# Altium project Zulu_a7_no_pmod_SI.PrjPcb (part 1 of 3)
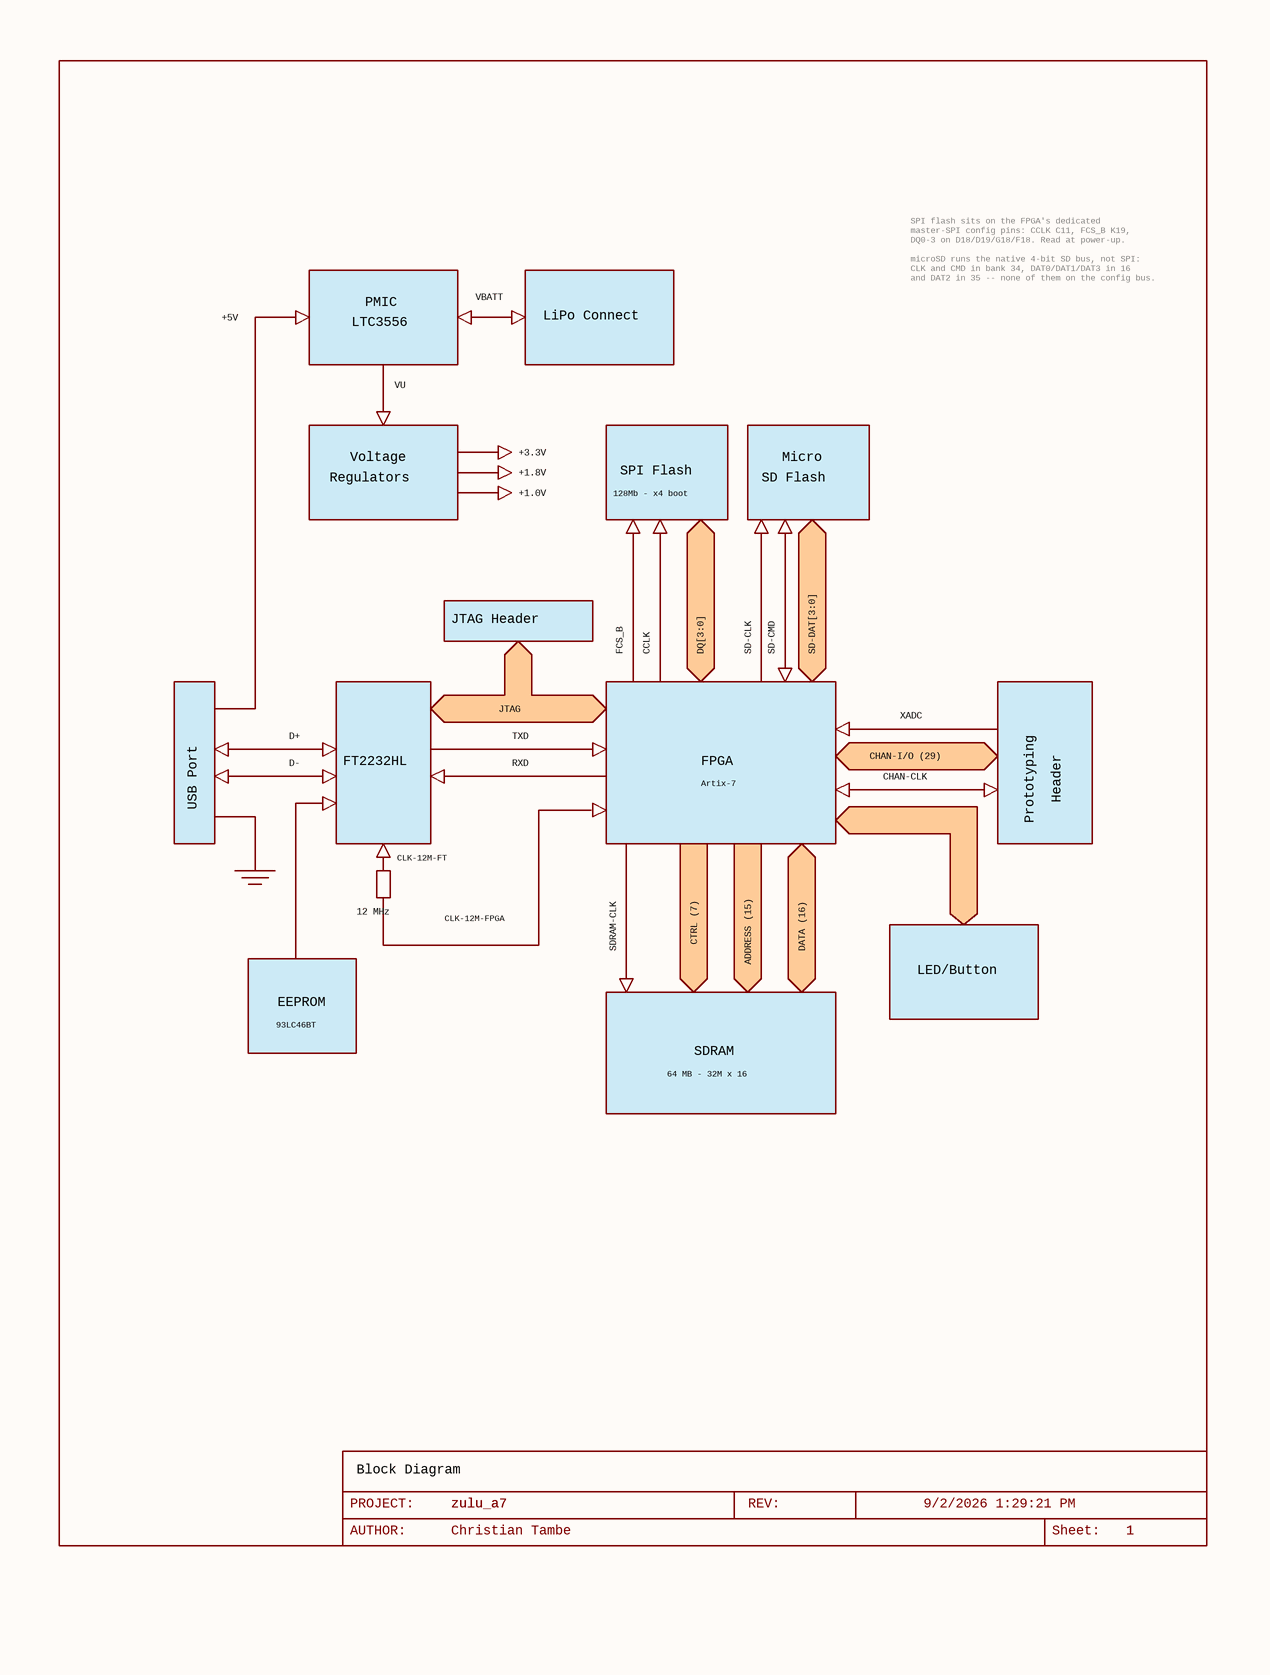
[diagram p0: zulu_a7_0.SchDoc]
7 sheets, 185 parts. Net scope: global (net labels, ports and power ports of the same name join across sheets).
Board file: Zulu_a7_no_pmod_SI.PcbDoc
Sheets:
  zulu_a7_0.SchDoc
  zulu_a7_1.SchDoc
  zulu_a7_2.SchDoc
  zulu_a7_3.SchDoc
  zulu_a7_4.SchDoc
  zulu_a7_5.SchDoc
  zulu_a7_6.SchDoc

## Sheet zulu_a7_0.SchDoc
size 236 x 313 mm; Author: Christian Tambe; VERSION#: 1.0; Origin: Eagle; OriginPath: C:\Users\tambe\Documents\Electronics\Zulu_A7\Zulu_Altrium\zulu_a7.sch; OriginSheet: 1; OriginDescription: Block Diagram

### Parts
FRAME1  LAST_DATE_TIME: 9/2/2026 1:29:21 PM  Sheet: Sheet:  SHEET: 1  REV: REV:  PROJECT: PROJECT:  DRAWING_NAME: zulu_a7  AUTHOR: Christian Tambe  (hidden comment: DOCFIELD)  (graphical)

### Notes on the sheet
- SPI flash sits on the FPGA's dedicated
  master-SPI config pins: CCLK C11, FCS_B K19,
  DQ0-3 on D18/D19/G18/F18. Read at power-up.
  microSD runs the native 4-bit SD bus, not SPI:
  CLK and CMD in bank 34, DAT0/DAT1/DAT3 in 16
  and DAT2 in 35 -- none of them on the config bus.
- +5V
- LTC3556
- PMIC
- VBATT
- LiPo Connect
- VU
- Regulators
- Voltage
- +3.3V
- +1.8V
- SPI Flash
- SD Flash
- Micro
- +1.0V
- 128Mb - x4 boot
- JTAG Header
- FCS_B
- CCLK
- DQ[3:0]
- SD-CLK
- SD-CMD
- SD-DAT[3:0]
- D+
- JTAG
- TXD
- XADC
- USB Port
- D-
- FT2232HL
- RXD
- FPGA
- Artix-7
- CHAN-I/O (29)
- CHAN-CLK
- Prototyping
- Header
- CLK-12M-FT
- 12 MHz
- CLK-12M-FPGA
- SDRAM-CLK
- CTRL (7)
- DATA (16)
- EEPROM
- ADDRESS (15)
- LED/Button
- 93LC46BT
- 64 MB - 32M x 16
- SDRAM
- (near FRAME1) Block Diagram
- (near FRAME1) AUTHOR:

### Library data of the parts
FRAME1 = DOCFIELD: DOCUMENT FIELD; GateName_1: G$1; SymbolName_1: DOCFIELD; LibraryName: ctambe; DeviceSetName: DOCFIELD

## Sheet zulu_a7_1.SchDoc
size 236 x 314 mm; Author: Christian Tambe; VERSION#: 1.0; Origin: Eagle; OriginPath: C:\Users\tambe\Documents\Electronics\Zulu_A7\Zulu_Altrium\zulu_a7.sch; OriginSheet: 2; OriginDescription: Power Supplies
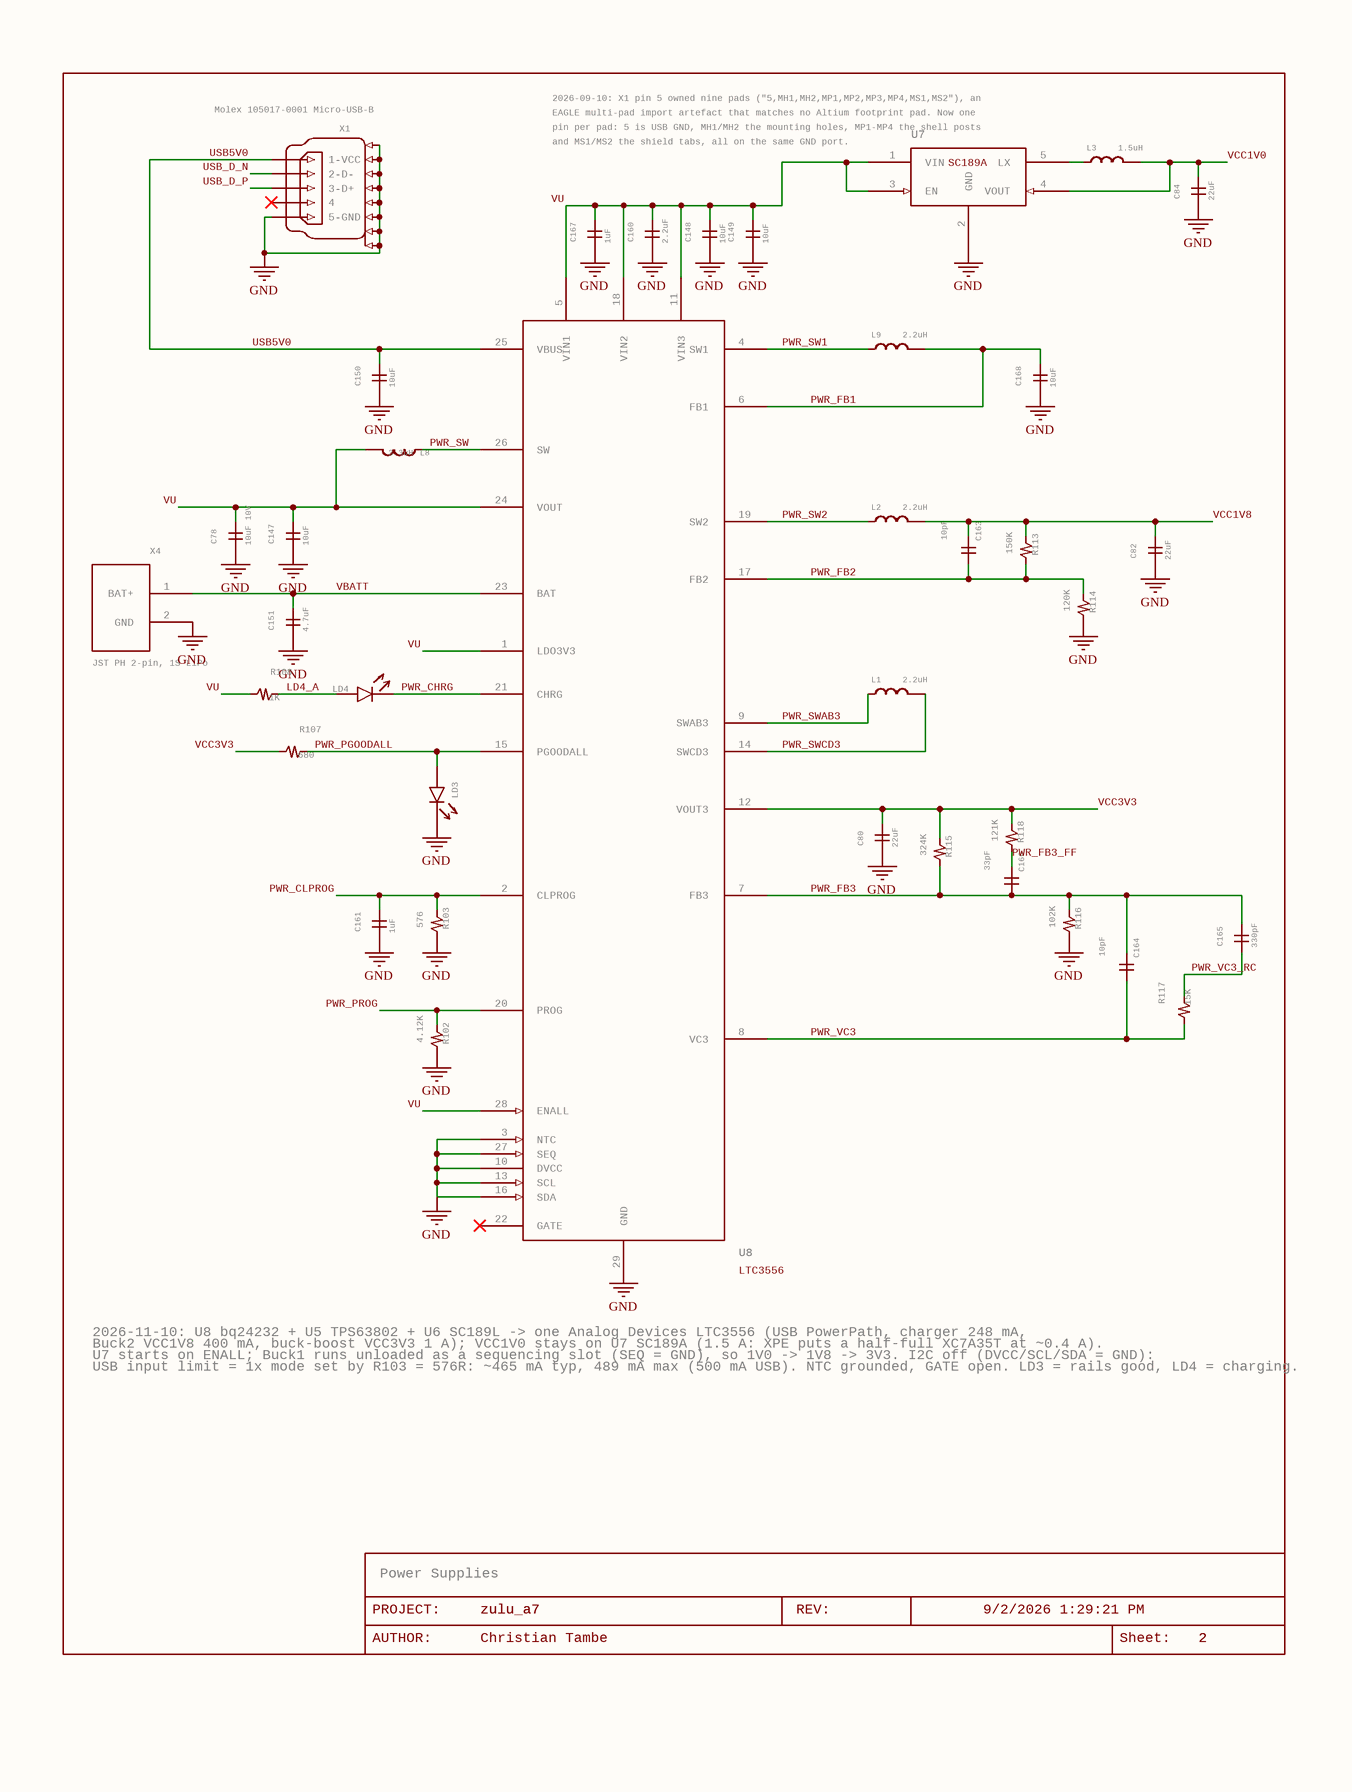
[diagram p1: zulu_a7_1.SchDoc]

### Parts
C78  10uF 10V  [C0805]
C80  22uF  [C0805]
C82  22uF  [C0603]
C84  22uF  [C0603]
C147  10uF  [C0603]
C148  10uF  [C0603]
C149  10uF  [C0805]
C150  10uF  [C0603]
C151  4.7uF  [C0603]
C160  2.2uF  [C0402]
C161  1uF  [C0402]
C163  10pF  [C0201]
C164  10pF  [C0201]
C165  330pF  [C0201]
C166  33pF  [C0201]
C167  1uF  [C0402]
C168  10uF  [C0603]
FRAME5  LAST_DATE_TIME: 9/2/2026 1:29:21 PM  Sheet: Sheet:  SHEET: 2  REV: REV:  PROJECT: PROJECT:  DRAWING_NAME: zulu_a7  AUTHOR: Christian Tambe  (hidden comment: DOCFIELD)  (graphical)
L1  2.2uH  [IND2520]
L2  2.2uH  [IND2520]
L3  1.5uH  [IND2520]
L8  3.3uH  [IND2520]
L9  2.2uH  [IND2520]
LD3  green  [LED0603]  (value not drawn)
LD4  green  [LED0603]  (value not drawn)
R102  4.12K  [R0402]
R103  576  [R0402]
R107  680  [R0402]
R108  1K  [R0402]
R113  150K  [R0201]
R114  120K  [R0201]
R115  324K  [R0201]
R116  102K  [R0201]
R117  15K  [R0201]
R118  121K  [R0201]
U7  PartName: SC189A  [SOT23-5]  (hidden comment: SC189ASKTRT)
U8  PartName: LTC3556  [QFN28-UFD-4X5]  (hidden comment: LTC3556EUFD#PBF)
X1  Molex 105017-0001 Micro-USB-B  [MOLEX-105017-0001]
X4  JST PH 2-pin, 1S LiPo  [JST-B2B-PH-SM4-TB]

### Nets
GND: C78.1 C80.1 C82.1 C84.1 C147.1 C148.1 C149.1 C150.1 C151.1 C160.1 C161.1 C167.1 C168.1 LD3.K R102.2 R103.2 R114.2 R116.2 U7.2(GND) U8.3(NTC) U8.10(DVCC) U8.13(SCL) U8.16(SDA) U8.27(SEQ) U8.29(GND) X1.5(5-GND) X1.MH1(GND) X1.MH2(GND) X1.MP1(GND) X1.MP2(GND) X1.MP3(GND) X1.MP4(GND) X1.MS1(GND) X1.MS2(GND) X4.2(GND)
VCC1V0: C84.2 L3.2 U7.4(VOUT)
VCC1V8: C82.2 C163.1 L2.2 R113.1
VCC3V3: C80.2 R107.1 R115.1 R118.1 U8.12(VOUT3)
LD4_A: LD4.A R108.2
PWR_CHRG: LD4.K U8.21(CHRG)
PWR_CLPROG: C161.2 R103.1 U8.2(CLPROG)
PWR_FB1: C168.2 L9.2 U8.6(FB1)
PWR_FB2: C163.2 R113.2 R114.1 U8.17(FB2)
PWR_FB3: C164.1 C165.2 C166.2 R115.2 R116.1 U8.7(FB3)
PWR_FB3_FF: C166.1 R118.2
PWR_PGOODALL: LD3.A R107.2 U8.15(PGOODALL)
PWR_PROG: R102.1 U8.20(PROG)
PWR_SW: L8.1 U8.26(SW)
PWR_SW1: L9.1 U8.4(SW1)
PWR_SW2: L2.1 U8.19(SW2)
PWR_SWAB3: L1.1 U8.9(SWAB3)
PWR_SWCD3: L1.2 U8.14(SWCD3)
PWR_VC3: C164.2 R117.1 U8.8(VC3)
PWR_VC3_RC: C165.1 R117.2
USB5V0: C150.2 U8.25(VBUS) X1.1(1-VCC)
USB_D_N: X1.2(2-D-)
USB_D_P: X1.3(3-D+)
VBATT: C151.2 U8.23(BAT) X4.1(BAT+)
VU: C78.2 C147.2 C148.2 C149.2 C160.2 C167.2 L8.2 R108.1 U7.1(VIN) U7.3(EN) U8.1(LDO3V3) U8.5(VIN1) U8.11(VIN3) U8.18(VIN2) U8.24(VOUT) U8.28(ENALL)
NetL3_1: L3.1 U7.5(LX)

Not connected (* = marked no-connect by the designer): U8 22(GATE)*; X1 4*

### Notes on the sheet
- 2026-09-10: X1 pin 5 owned nine pads ("5,MH1,MH2,MP1,MP2,MP3,MP4,MS1,MS2"), an
- (near U7) EAGLE multi-pad import artefact that matches no Altium footprint pad. Now one
- (near U7) pin per pad: 5 is USB GND, MH1/MH2 the mounting holes, MP1-MP4 the shell posts
- and MS1/MS2 the shield tabs, all on the same GND port.
- 2026-11-10: U8 bq24232 + U5 TPS63802 + U6 SC189L -> one Analog Devices LTC3556 (USB PowerPath, charger 248 mA,
- Buck2 VCC1V8 400 mA, buck-boost VCC3V3 1 A); VCC1V0 stays on U7 SC189A (1.5 A: XPE puts a half-full XC7A35T at ~0.4 A).
- U7 starts on ENALL; Buck1 runs unloaded as a sequencing slot (SEQ = GND), so 1V0 -> 1V8 -> 3V3. I2C off (DVCC/SCL/SDA = GND):
- USB input limit = 1x mode set by R103 = 576R: ~465 mA typ, 489 mA max (500 mA USB). NTC grounded, GATE open. LD3 = rails good, LD4 = charging.
- (near FRAME5) Power Supplies
- (near FRAME5) AUTHOR:

### Library data of the parts
C78 = C-GENERICC0603: CAPACITOR, generic non-polarized, horizontal pins; GateName_1: G$1; SymbolName_1: C-GENERIC-H; MANF: Samsung; MANF#: CL21A106KPFNNNG; SPEC: X5R 10V +-10% 0805 10uF -- VU bulk; DeviceName: C0805; LibraryName: rcl; DeviceSetName: C-GENERIC
C80 = C-GENERICC0603: CAPACITOR, generic non-polarized, horizontal pins; GateName_1: G$1; SymbolName_1: C-GENERIC-H; MANF: Murata; MANF#: GRM21BR61A226ME44L; SPEC: X5R 10V +-20% 0805 22uF -- buck-boost (VCC3V3) output capacitor, the 22 uF the Type III values assume; DeviceName: C0805; LibraryName: rcl; DeviceSetName: C-GENERIC
C82 = C-GENERICC0603: CAPACITOR, generic non-polarized, horizontal pins; GateName_1: G$1; SymbolName_1: C-GENERIC-H; MANF: Samsung; MANF#: CL10A226MP8NUNE; SPEC: X5R 10V +-20% 0603 22uF -- Buck2 (VCC1V8) output capacitor; DeviceName: C0603; LibraryName: rcl; DeviceSetName: C-GENERIC
C84 = C-GENERICC0603: CAPACITOR, generic non-polarized, horizontal pins; GateName_1: G$1; SymbolName_1: C-GENERIC-H; MANF: Samsung; MANF#: CL10A226MP8NUNE; SPEC: X5R 10V +-20% 0603 22uF -- U7 SC189A (VCC1V0) output capacitor; DeviceName: C0603; LibraryName: rcl; DeviceSetName: C-GENERIC
C147 = C-GENERICC0603: CAPACITOR, generic non-polarized, horizontal pins; GateName_1: G$1; SymbolName_1: C-GENERIC-H; MANF: Murata; MANF#: GRM188R61A106KE69D; SPEC: X5R 10V +-10% 0603 10uF -- LTC3556 VOUT (PowerPath output, pin 24) bypass; DeviceName: C0603; LibraryName: rcl; DeviceSetName: C-GENERIC
C148 = C-GENERICC0603: CAPACITOR, generic non-polarized, horizontal pins; GateName_1: G$1; SymbolName_1: C-GENERIC-H; MANF: Murata; MANF#: GRM188R61A106KE69D; SPEC: X5R 10V +-10% 0603 10uF -- LTC3556 VIN3 (buck-boost input, pin 11) bypass; DeviceName: C0603; LibraryName: rcl; DeviceSetName: C-GENERIC
C149 = C-GENERICC0805: CAPACITOR, generic non-polarized, horizontal pins; GateName_1: G$1; SymbolName_1: C-GENERIC-H; MANF: Samsung; MANF#: CL21A106KPFNNNG; SPEC: X5R 10V +-10% 0805 10uF -- U7 SC189A VIN bypass (>= 4.7 uF effective); DeviceName: C0805; LibraryName: rcl; DeviceSetName: C-GENERIC
C150 = C-GENERICC0603: CAPACITOR, generic non-polarized, horizontal pins; GateName_1: G$1; SymbolName_1: C-GENERIC-H; MANF: Murata; MANF#: GRM188R61C106MA73D; SPEC: X5R 16V +-20% 0603 10uF -- LTC3556 VBUS bypass (pin 25); DeviceName: C0603; LibraryName: rcl; DeviceSetName: C-GENERIC
C151 = C-GENERICC0603: CAPACITOR, generic non-polarized, horizontal pins; GateName_1: G$1; SymbolName_1: C-GENERIC-H; MANF: Murata; MANF#: GRM188R61C475KE11D; SPEC: X5R 16V +-10% 0603 4.7uF -- LTC3556 BAT bypass (pin 23), 1-22 uF ceramic; DeviceName: C0603; LibraryName: rcl; DeviceSetName: C-GENERIC
C160 = C-GENERICC0603: CAPACITOR, generic non-polarized, horizontal pins; GateName_1: G$1; SymbolName_1: C-GENERIC-H; MANF: Murata; MANF#: GRM155R61A225KE95D; SPEC: X5R 10V +-10% 0402 2.2uF -- LTC3556 VIN2 (Buck2 input, pin 18) bypass; DeviceName: C0402; LibraryName: rcl; DeviceSetName: C-GENERIC
C161 = C-GENERICC0603: CAPACITOR, generic non-polarized, horizontal pins; GateName_1: G$1; SymbolName_1: C-GENERIC-H; MANF: Murata; MANF#: GRM155R61A105KE15D; SPEC: X5R 10V +-10% 0402 1uF -- LTC3556 CLPROG averaging capacitor (>= 0.47 uF); DeviceName: C0402; LibraryName: rcl; DeviceSetName: C-GENERIC
C163 = C-GENERICC0603: CAPACITOR, generic non-polarized, horizontal pins; GateName_1: G$1; SymbolName_1: C-GENERIC-H; MANF: Murata; MANF#: GRM0335C1H100JA01D; SPEC: C0G 50V +-5% 0201 10pF -- Buck2 feed-forward across R113; DeviceName: C0201; LibraryName: rcl; DeviceSetName: C-GENERIC
C164 = C-GENERICC0603: CAPACITOR, generic non-polarized, horizontal pins; GateName_1: G$1; SymbolName_1: C-GENERIC-H; MANF: Murata; MANF#: GRM0335C1H100JA01D; SPEC: C0G 50V +-5% 0201 10pF -- Type III C1 (FB3 to VC3); DeviceName: C0201; LibraryName: rcl; DeviceSetName: C-GENERIC
C165 = C-GENERICC0603: CAPACITOR, generic non-polarized, horizontal pins; GateName_1: G$1; SymbolName_1: C-GENERIC-H; MANF: Murata; MANF#: GRM0335C1H331JA01D; SPEC: C0G 50V +-5% 0201 330pF -- Type III C2; DeviceName: C0201; LibraryName: rcl; DeviceSetName: C-GENERIC
C166 = C-GENERICC0603: CAPACITOR, generic non-polarized, horizontal pins; GateName_1: G$1; SymbolName_1: C-GENERIC-H; MANF: Murata; MANF#: GRM0335C1H330JA01D; SPEC: C0G 50V +-5% 0201 33pF -- Type III C3; DeviceName: C0201; LibraryName: rcl; DeviceSetName: C-GENERIC
C167 = C-GENERICC0603: CAPACITOR, generic non-polarized, horizontal pins; GateName_1: G$1; SymbolName_1: C-GENERIC-H; MANF: Murata; MANF#: GRM155R61A105KE15D; SPEC: X5R 10V +-10% 0402 1uF -- LTC3556 VIN1 (Buck1 input, pin 5) bypass, the 1 uF the datasheet asks for; DeviceName: C0402; LibraryName: rcl; DeviceSetName: C-GENERIC
C168 = C-GENERICC0603: CAPACITOR, generic non-polarized, horizontal pins; GateName_1: G$1; SymbolName_1: C-GENERIC-H; MANF: Murata; MANF#: GRM188R61A106KE69D; SPEC: X5R 10V +-10% 0603 10uF -- LTC3556 Buck1 output (sequencing slot, FB1 tied to it: 0.8 V, no load); DeviceName: C0603; LibraryName: rcl; DeviceSetName: C-GENERIC
FRAME5 = DOCFIELD: DOCUMENT FIELD; GateName_1: G$1; SymbolName_1: DOCFIELD; LibraryName: ctambe; DeviceSetName: DOCFIELD
L1 = INDUCTOR-2520: INDUCTOR, generic power inductor; GateName_1: G$1; MANF: Murata; MANF#: DFE252012F-2R2M=P2; SPEC: 2.2uH +-20%, Isat 3.3 A, Itemp 2.3 A, DCR 82 mOhm max, 2520 1.2 mm -- LTC3556 buck-boost (VCC3V3) inductor, SWAB3 to SWCD3; SymbolName_1: INDUCTOR; DeviceName: IND2520; LibraryName: ctambe; DeviceSetName: INDUCTOR
L2 = INDUCTOR-2520: INDUCTOR, generic power inductor; GateName_1: G$1; MANF: Murata; MANF#: DFE252012F-2R2M=P2; SPEC: 2.2uH +-20%, Isat 3.3 A, Itemp 2.3 A, DCR 82 mOhm max, 2520 1.2 mm -- LTC3556 Buck2 (VCC1V8) inductor (2520 like L1/L3: no verified Murata land pattern for the 2016 part); SymbolName_1: INDUCTOR; DeviceName: IND2520; LibraryName: ctambe; DeviceSetName: INDUCTOR
L3 = INDUCTOR-2520: INDUCTOR, generic power inductor; GateName_1: G$1; DeviceName: -2520; MANF: Murata; MANF#: DFE252010P-1R5M=P2; SPEC: 1.5uH +-20%, Isat >=1.8A, 1.00 mm max -- U7 SC189A LX inductor (VCC1V0), 2.5 MHz, <=0.31 A p-p ripple; SymbolName_1: INDUCTOR; LibraryName: ctambe; DeviceSetName: INDUCTOR
L8 = INDUCTOR-2520: INDUCTOR, generic power inductor; GateName_1: G$1; MANF: Murata; MANF#: DFE252012F-3R3M=P2; SPEC: 3.3uH +-20%, Isat 2.5 A, Itemp 1.8 A, DCR 135 mOhm max, 2520 1.2 mm -- LTC3556 PowerPath inductor (SW to VOUT); SymbolName_1: INDUCTOR; DeviceName: IND2520; LibraryName: ctambe; DeviceSetName: INDUCTOR
L9 = INDUCTOR-2520: INDUCTOR, generic power inductor; GateName_1: G$1; MANF: Murata; MANF#: DFE252012F-2R2M=P2; SPEC: 2.2uH +-20%, 2520 -- LTC3556 Buck1 kept running unloaded as the sequencing slot (SEQ = GND: Buck1 -> Buck2 -> buck-boost), so 1.8 V starts after U7 has brought up 1.0 V; SymbolName_1: INDUCTOR; DeviceName: IND2520; LibraryName: ctambe; DeviceSetName: INDUCTOR
LD3 = LED: GateName_1: G$1; MANF: Lite-On; MANF#: LTST-C191KGKT; NOTE: Power good: R107 680R from VCC3V3 lights LD3 once LTC3556 PGOODALL (pin 15, open drain) releases; PGOODALL holds it off until all three bucks are in regulation; SPEC: green -- LTC3556 PGOODALL: all three rails good (lights 230 ms after VCC3V3 is up); SymbolName_1: LED; LibraryName: ctambe; DeviceSetName: LED
LD4 = LED: GateName_1: G$1; MANF: Lite-On; MANF#: LTST-C191KGKT; NOTE: Charge status: LTC3556 CHRG (pin 21, open drain) sinks LD4 through R108 1.0k from VU while the battery charges; SPEC: green -- LTC3556 CHRG: on = charging, off = done / no USB, fast blink = bad battery; SymbolName_1: LED; LibraryName: ctambe; DeviceSetName: LED
R102 = R-US_SMALLR0402: RESISTOR, American symbol, small 2-zigzag variant (sheet 2 only); GateName_1: G$1; MANF: Yageo; MANF#: RC0402FR-074K12L; SPEC: thick film +-1% 0402 -- LTC3556 PROG: 1022 V / 4.12k = 248 mA charge current; SymbolName_1: R-US_SMALL; DeviceName: R0402; LibraryName: rcl; DeviceSetName: R-US_SMALL
R103 = R-US_SMALLR0402: RESISTOR, American symbol, small 2-zigzag variant (sheet 2 only); GateName_1: G$1; MANF: Yageo; MANF#: RC0402FR-07576RL; SPEC: thick film +-1% 0402 -- LTC3556 CLPROG, 500 mA USB limit with I2C off (1x mode, hCLPROG 224): 1.188 V x 225 / 576 = 464 mA + 0.4 mA typ, ~425-489 mA over the datasheet spread; CLPROG pin 2.1 mA < 3 mA abs max; SymbolName_1: R-US_SMALL; DeviceName: R0402; LibraryName: rcl; DeviceSetName: R-US_SMALL
R107 = R-US_SMALLR0402: RESISTOR, American symbol, small 2-zigzag variant (sheet 2 only); GateName_1: G$1; MANF: Yageo; MANF#: RC0402FR-07680RL; SPEC: thick film +-1% 0402 -- PGOODALL pull-up and LD3 current: (3.3 - 2.0) / 680 = 1.9 mA; SymbolName_1: R-US_SMALL; DeviceName: R0402; LibraryName: rcl; DeviceSetName: R-US_SMALL
R108 = R-US_SMALLR0402: RESISTOR, American symbol, small 2-zigzag variant (sheet 2 only); GateName_1: G$1; MANF: Yageo; MANF#: RC0402FR-071KL; SPEC: thick film +-1% 0402 -- LD4 (CHRG) current: (3.7 - 2.0) / 1.0k = 1.7 mA; SymbolName_1: R-US_SMALL; DeviceName: R0402; LibraryName: rcl; DeviceSetName: R-US_SMALL
R113 = R-US_SMALLR0402: RESISTOR, American symbol, small 2-zigzag variant (sheet 2 only); GateName_1: G$1; MANF: Yageo; MANF#: RC0201FR-07150KL; SPEC: thick film +-1% 0201 -- Buck2 divider top: 0.8 V x (1 + 150k/120k) = 1.800 V; SymbolName_1: R-US_SMALL; DeviceName: R0201; LibraryName: rcl; DeviceSetName: R-US_SMALL
R114 = R-US_SMALLR0402: RESISTOR, American symbol, small 2-zigzag variant (sheet 2 only); GateName_1: G$1; MANF: Yageo; MANF#: RC0201FR-07120KL; SPEC: thick film +-1% 0201 -- Buck2 divider bottom; SymbolName_1: R-US_SMALL; DeviceName: R0201; LibraryName: rcl; DeviceSetName: R-US_SMALL
R115 = R-US_SMALLR0402: RESISTOR, American symbol, small 2-zigzag variant (sheet 2 only); GateName_1: G$1; MANF: Yageo; MANF#: RC0201FR-07324KL; SPEC: thick film +-1% 0201 -- buck-boost divider top / Type III R1 (sets the compensation; keep): 0.8 V x (1 + 324k/104k) = 3.29 V; SymbolName_1: R-US_SMALL; DeviceName: R0201; LibraryName: rcl; DeviceSetName: R-US_SMALL
R116 = R-US_SMALLR0402: RESISTOR, American symbol, small 2-zigzag variant (sheet 2 only); GateName_1: G$1; MANF: Yageo; MANF#: RC0201FR-07102KL; SPEC: thick film +-1% 0201 -- buck-boost divider bottom (RFB, DC only): VCC3V3 = 0.8 V x (1 + 324k/102k) = 3.34 V (2026-11-11: 104k 0.1% ERA-1AEB1043C does not exist; ERA-1AEB 0201 stops at 10k); SymbolName_1: R-US_SMALL; DeviceName: R0201; LibraryName: rcl; DeviceSetName: R-US_SMALL
R117 = R-US_SMALLR0402: RESISTOR, American symbol, small 2-zigzag variant (sheet 2 only); GateName_1: G$1; MANF: Yageo; MANF#: RC0201FR-0715KL; SPEC: thick film +-1% 0201 -- Type III R2 (with C165, VC3 to FB3); SymbolName_1: R-US_SMALL; DeviceName: R0201; LibraryName: rcl; DeviceSetName: R-US_SMALL
R118 = R-US_SMALLR0402: RESISTOR, American symbol, small 2-zigzag variant (sheet 2 only); GateName_1: G$1; MANF: Yageo; MANF#: RC0201FR-07121KL; SPEC: thick film +-1% 0201 -- Type III R3 (with C166 across R115); SymbolName_1: R-US_SMALL; DeviceName: R0201; LibraryName: rcl; DeviceSetName: R-US_SMALL
U7 = SC189-SOT23-5: 1.5A 2.5MHz synchronous buck, fixed output (Semtech SC189); MANF: Semtech; MANF#: SC189ASKTRT
U8 = LTC3556-UFD28: USB power manager: PowerPath + Li-ion charger + dual 400 mA buck + 1 A buck-boost (Analog Devices LTC3556, UFD QFN-28 4 x 5 mm); MANF: Analog Devices; MANF#: LTC3556EUFD#PBF
X1 = MINI-USB-105017-0001: MINI USB Connector   Source: http://www.hirose.co.jp/cataloge_hp/e24000019.pdf; GateName_1: G$1; SymbolName_1: MINI-USB; DeviceName: 105017-0001; LibraryName: ctambe; DeviceSetName: MINI-USB-; MANF: Molex; MANF#: 105017-0001
X4 = JST-B2B-PH-SM4-TB: JST PH 2.0 mm 2-pin top-entry SMT header, LiPo battery input; GateName_1: G$1; SymbolName_1: CONN-2; DeviceName: SM4-TB; DeviceSetName: JST-PH-2; MANF#: B2B-PH-SM4-TB(LF)(SN); SPEC: JST PH 2.0 mm, 2 circuits, top-entry SMT header with fixing tabs, 2 A, 100 V, -25..85 C, mates with PHR-2 housing; pin 1 = battery +, pin 2 = GND; NOTE: B2B-PH-SM4-TB(LF)(SN): 8 mm tall, wire leaves upward; the side-entry twin is S2B-PH-SM4-TB(LF)(SN) (5.5 mm). There is no polarity standard for JST-PH LiPo packs: check pin 1 = + against the pack before plugging in. Footprint JST-B2B-PH-SM4-TB to draw from the catalog page (two contact pads on 2.0 mm plus two 1.6 x 3.0 mm fixing pads). Digi-Key 57,541 in stock at $0.47 on 2026-09-09.; LibraryName: ctambe; MANF: JST

## Sheet zulu_a7_2.SchDoc
size 270 x 341 mm; Author: Christian Tambe; VERSION#: 1.0; Origin: Eagle; OriginPath: C:\Users\tambe\Documents\Electronics\Zulu_A7\Zulu_Altrium\zulu_a7.sch; OriginSheet: 3; OriginDescription: General IO
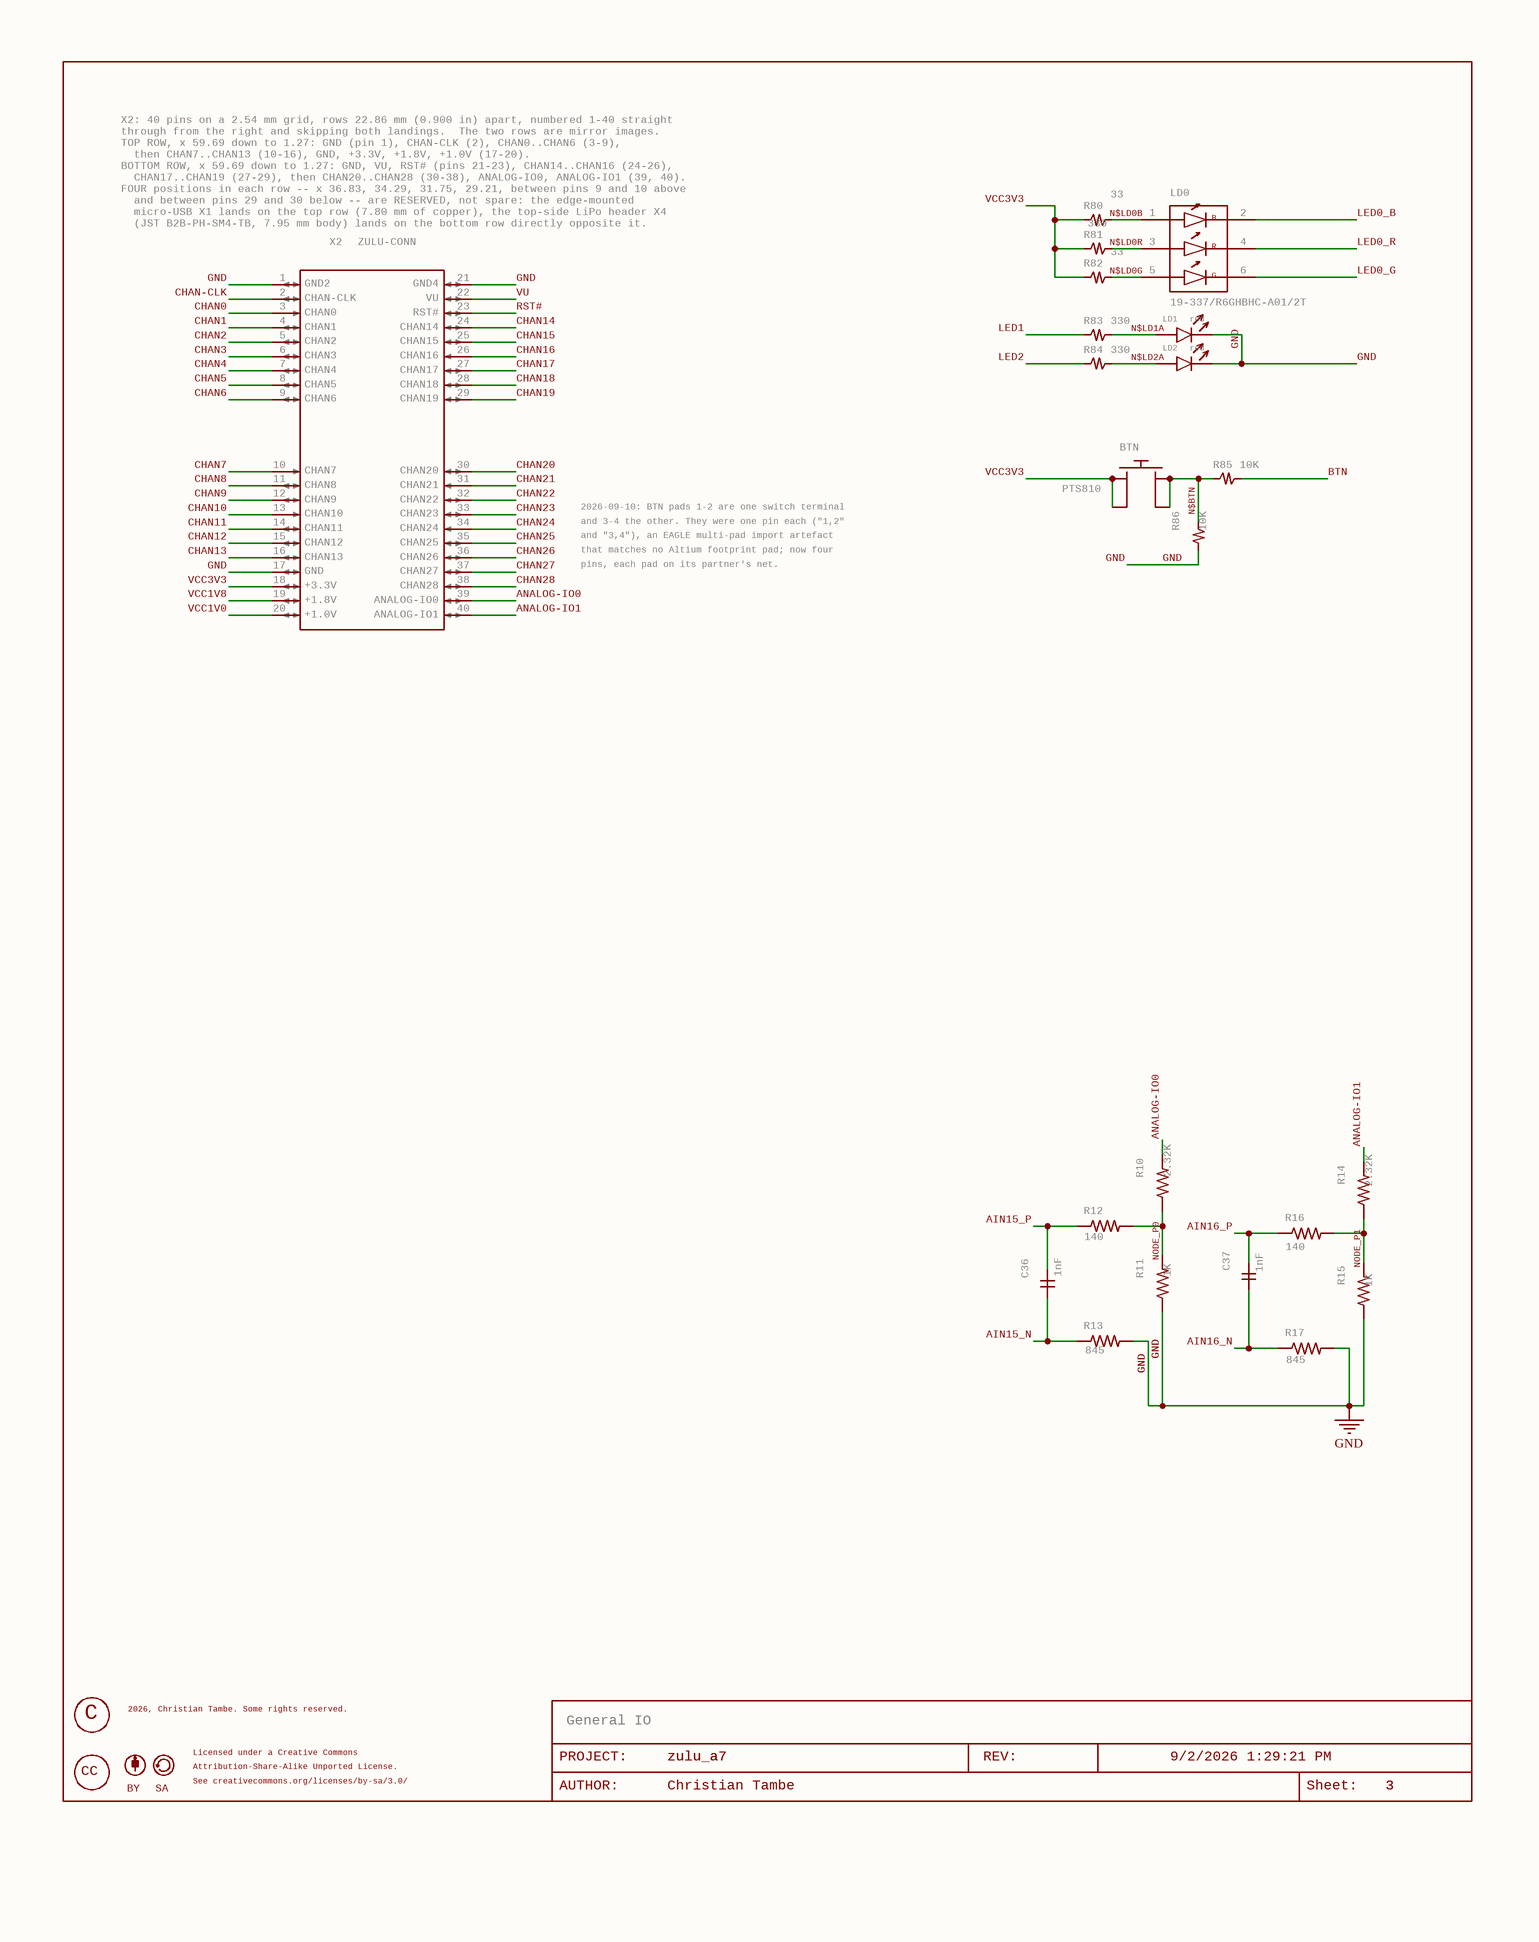
[diagram p2: zulu_a7_2.SchDoc]

### Parts
BTN  PTS810  [PTS810]
C36  1nF  [C0402]
C37  1nF  [C0402]
FRAME3  LAST_DATE_TIME: 9/2/2026 1:29:21 PM  Sheet: Sheet:  SHEET: 3  REV: REV:  PROJECT: PROJECT:  DRAWING_NAME: zulu_a7  AUTHOR: Christian Tambe  (hidden comment: DOCFIELD)  (graphical)
LD0  19-337/R6GHBHC-A01/2T  [EVERLIGHT-19-337]
LD1  red  [LED0603]
LD2  red  [LED0603]
R10  2.32K  [R0201]
R11  1K  [R0201]
R12  140  [R0201]
R13  845  [R0201]
R14  2.32K  [R0201]
R15  1K  [R0201]
R16  140  [R0201]
R17  845  [R0201]
R80  33  [R0402]
R81  330  [R0402]
R82  33  [R0402]
R83  330  [R0402]
R84  330  [R0402]
R85  10K  [R0402]
R86  10K  [R0402]
U$2  CC_CC  [CC_CC]  (value not drawn)
U$3  CC_BY  [CC_BY]  (value not drawn)
U$4  CC_SA  [CC_SA]  (value not drawn)
U$5  CC_COPYRIGHT  [CC_COPYRIGHT]  (value not drawn)
X2  GATE: CHAN-CLK  [ZULU-DIP37]  (hidden comment: ZULU-CONN)  (parts A,B,C,D,E,F,G,H,I,J,K,L,M,N,O,P,Q,R,S,T,U,V,W,X,Y,Z,27,28,29,30,31,32,33,34,35,36,37,38,39,40,41 of 41)

### Nets
GND: LD1.K LD2.K R11.1 R13.2 R15.1 R17.2 R86.1 X2.1 X2.17 X2.21
VCC1V0: X2.20
VCC1V8: X2.19
VCC3V3: BTN.1 BTN.2 R80.1 R81.1 R82.1 X2.18
AIN15_N: C36.1 R13.1
AIN15_P: C36.2 R12.1
AIN16_N: C37.1 R17.1
AIN16_P: C37.2 R16.1
ANALOG-IO0: R10.2 X2.39
ANALOG-IO1: R14.2 X2.40
BTN: R85.2
CHAN0: X2.3
CHAN1: X2.4
CHAN2: X2.5
CHAN3: X2.6
CHAN4: X2.7
CHAN5: X2.8
CHAN6: X2.9
CHAN7: X2.10
CHAN8: X2.11
CHAN9: X2.12
CHAN10: X2.13
CHAN11: X2.14
CHAN12: X2.15
CHAN13: X2.16
CHAN14: X2.24
CHAN15: X2.25
CHAN16: X2.26
CHAN17: X2.27
CHAN18: X2.28
CHAN19: X2.29
CHAN20: X2.30
CHAN21: X2.31
CHAN22: X2.32
CHAN23: X2.33
CHAN24: X2.34
CHAN25: X2.35
CHAN26: X2.36
CHAN27: X2.37
CHAN28: X2.38
CHAN-CLK: X2.2
LED0_B: LD0.2
LED0_G: LD0.6
LED0_R: LD0.4
LED1: R83.1
LED2: R84.1
N$BTN: BTN.3 BTN.4 R85.1 R86.2
N$LD0B: LD0.1 R80.2
N$LD0G: LD0.5 R82.2
N$LD0R: LD0.3 R81.2
N$LD1A: LD1.A R83.2
N$LD2A: LD2.A R84.2
NODE_P0: R10.1 R11.2 R12.2
NODE_P1: R14.1 R15.2 R16.2
RST#: X2.23
VU: X2.22

### Notes on the sheet
- (near X2) X2: 40 pins on a 2.54 mm grid, rows 22.86 mm (0.900 in) apart, numbered 1-40 straight
  through from the right and skipping both landings.  The two rows are mirror images.
  TOP ROW, x 59.69 down to 1.27: GND (pin 1), CHAN-CLK (2), CHAN0..CHAN6 (3-9),
  then CHAN7..CHAN13 (10-16), GND, +3.3V, +1.8V, +1.0V (17-20).
  BOTTOM ROW, x 59.69 down to 1.27: GND, VU, RST# (pins 21-23), CHAN14..CHAN16 (24-26),
  CHAN17..CHAN19 (27-29), then CHAN20..CHAN28 (30-38), ANALOG-IO0, ANALOG-IO1 (39, 40).
  FOUR positions in each row -- x 36.83, 34.29, 31.75, 29.21, between pins 9 and 10 above
  and between pins 29 and 30 below -- are RESERVED, not spare: the edge-mounted
  micro-USB X1 lands on the top row (7.80 mm of copper), the top-side LiPo header X4
  (JST B2B-PH-SM4-TB, 7.95 mm body) lands on the bottom row directly opposite it.
  Each landing is 12.70 mm between the neighbouring pin centres, 11.176 mm clear.
  THREE grounds: pins 1, 17, 21.  Pin 18 is the only +3.3V pin.  Pin 22 VU SOURCES the
  4.4 V rail (bq24232 OUT) -- the +5V-INPUT pin and its D2/D3 went on 2026-09-09,
  so external power is the LiPo on X4.  THE PCB FOOTPRINT MUST BE REDRAWN: 40 pads named 1-40.
- 2026-09-10: BTN pads 1-2 are one switch terminal
- and 3-4 the other. They were one pin each ("1,2"
- and "3,4"), an EAGLE multi-pad import artefact
- that matches no Altium footprint pad; now four
- pins, each pad on its partner's net.
- 2026, Christian Tambe. Some rights reserved.
- (near FRAME3) General IO
- (near U$4) Licensed under a Creative Commons
- (near U$4) Attribution-Share-Alike Unported License.
- (near U$4) See creativecommons.org/licenses/by-sa/3.0/
- (near FRAME3) AUTHOR:

### Library data of the parts
BTN = SWITCH_TACT: Tactile switch, momentary, normally open. Package PTA-142 is assigned and drawn from the datasheet land; the note that said otherwise was left behind when it was.; GateName_1: G$1; MANF#: PTS810SJM250SMTR LFS; MANF: Littelfuse (C&K); NOTE: PTS810SJM250SMTR LFS, Littelfuse (C&K) PTS810 series, Datasheet/Littelfuse-CK-Tactile-PTS810-Series-Datasheet.pdf rev 02/02/26. Recommended PCB layout (p1): four pads (5.2 - 3.1)/2 = 1.05 mm wide by (2.8 - 1.5)/2 = 0.65 mm high, centred at +-2.075 mm and +-1.075 mm; body 4.2 x 3.2 mm, J-leads to 4.6 mm, height 2.5 mm. The datasheet schematic joins 1 with 2 and 3 with 4, so pins 1,2 (VCC3V3) and 3,4 (BTN) are unchanged. Footprint PTS810 to be drawn at the PCB stage; the PTA-142 pattern (1.6 mm pads at +-3.75 / +-1.4 mm) does not fit. Other force grades on the same pads: K 2.6 N, G 4.0 N, S 6.0 N. Digi-Key 106,352 in stock at $0.58, 16-week lead (2026-09-08); LCSC C116501 dry, the K grade C221896 stocked.; SPEC: tactile switch SPST-NO momentary, SMT J-lead, 4.2 x 3.2 x 2.5 mm, 1.6 N (160 gf), 0.15 mm travel, 150000 cycles, 16 VDC 50 mA, -40..85 C; terminals 1-2 and 3-4 internally common (PTS810 sheet p1); replaced the unsourceable PTA-142 on 2026-09-08; SymbolName_1: SWITCH_TACT; LibraryName: ctambe; DeviceSetName: SWITCH_TACT
C36 C37 = C-GENERICC0402: CAPACITOR, generic non-polarized, horizontal pins; GateName_1: G$1; SymbolName_1: C-GENERIC-H; MANF: Murata; MANF#: GRM155R71H102KA01D; SPEC: X7R 50V +-10%, 0.50 mm max; DeviceName: C0402; LibraryName: rcl; DeviceSetName: C-GENERIC
FRAME3 = DOCFIELD: DOCUMENT FIELD; GateName_1: G$1; SymbolName_1: DOCFIELD; LibraryName: ctambe; DeviceSetName: DOCFIELD
LD0 = LED_RGB: RGB LED, three independent diodes, 6 pads: anodes 1/3/5 (B/R/G), cathodes 2/4/6 (B/R/G). Everlight 19-337 package.; GateName_1: G$1; NOTE: Everlight EAST1616RGBA8 = 19-337/R6GHBHW-A01/2T (DSE-0009126 Rev.3, 22-Dec-2016); water-clear twin EAST1616RGBA4 = 19-337/R6GHBHC-A01/2T. Same body, lens and recommended pads as the Victory VS NRD8 it replaces (0.55 x 0.4 outer pads at +-0.725 mm, 0.7 x 0.5 middle, 1.9 / 2.2 mm spans) and the same arrangement: cathodes in the left column under the cathode mark, blue / red / green top to bottom, anodes on the right. Only the numbering differs (Everlight anodes 1/3/5 on the right, cathodes 2/4/6 on the left), so on 2026-09-08 the pins were renumbered 1/2/3 -> 2/4/6 and 4/5/6 -> 1/3/5 with the nets unchanged: LED0_B/R/G on the cathodes to the FPGA, N$LD0B/R/G on the anodes through R80/R81/R82. Footprint EVERLIGHT-19-337 = the VS-NRD8 pattern with Everlight pad numbers. Digi-Key 15,840 in stock at $0.43 on 2026-09-08. 2026-10-23: replaced by 19-337/R6GHBHC-A01/2T (= EAST1616RGBA4, the water-clear twin; Everlight DSE-0002657 Rev.4), as quoted by PCBWay and approved by the user. Same body, pads and physical pin arrangement: cathodes in the cathode-mark column, blue / red / green top to bottom. That sheet numbers the cathodes 1/2/3 and the anodes 4/5/6; the footprint keeps the 2/4/6 and 1/3/5 numbering, so no net or footprint change. VF at 20 mA 1.7-2.4 / 2.7-3.8 / 2.7-3.8 V (the diffused A8: 2.4 / 3.7 / 3.7 max).; SPEC: RGB LED, three independent diodes, 1.6 x 1.6 x 0.35 mm, water-clear lens, 624 / 525 / 470 nm, VF at 20 mA 1.7-2.4 / 2.7-3.8 / 2.7-3.8 V, IF 25 mA max per colour; footprint pads: anodes 1 B, 3 R, 5 G, cathodes 2 B, 4 R, 6 G (datasheet Rev.4 numbers the cathodes 1/2/3 and the anodes 4/5/6, Rev.6 like the footprint); replaced the diffused EAST1616RGBA8 on 2026-10-23; SymbolName_1: LED_RGB; LibraryName: ctambe; DeviceSetName: LED_RGB; B: B; R: R; G: G; MANF: Everlight; MANF#: 19-337/R6GHBHC-A01/2T
LD1 = LED: GateName_1: G$1; MANF: Lite-On; MANF#: LTST-C191KRKT; NOTE: User status LED, driven straight off an FPGA pin through R83 at 330R: (3.3 - Vf)/330 is 3.9 mA green, 4.2 red, 3.6 yellow, and 1.2 mA blue or white. Any of the first three is comfortable and well inside an LVCMOS33 pin's 12 mA. RED IS A PREFERENCE, NOT A CONSTRAINT -- the circuit takes green just as happily. It is red so that the two user LEDs read differently from LD3, which is green and means power good; on a board being brought up that is worth being able to tell apart at a glance. Same LTST-C191 family and the same 0603 land as LD5, so it is one line in the catalogue, not two. Confirm the suffix before ordering.; SPEC: red indicator, 0603, Vf 2.1V max at 4mA; SymbolName_1: LED; LibraryName: ctambe; DeviceSetName: LED
LD2 = LED: GateName_1: G$1; MANF: Lite-On; MANF#: LTST-C191KRKT; NOTE: User status LED, driven straight off an FPGA pin through R84 at 330R: (3.3 - Vf)/330 is 3.9 mA green, 4.2 red, 3.6 yellow, and 1.2 mA blue or white. Any of the first three is comfortable and well inside an LVCMOS33 pin's 12 mA. RED IS A PREFERENCE, NOT A CONSTRAINT -- the circuit takes green just as happily. It is red so that the two user LEDs read differently from LD3, which is green and means power good; on a board being brought up that is worth being able to tell apart at a glance. Same LTST-C191 family and the same 0603 land as LD5, so it is one line in the catalogue, not two. Confirm the suffix before ordering.; SPEC: red indicator, 0603, Vf 2.1V max at 4mA; SymbolName_1: LED; LibraryName: ctambe; DeviceSetName: LED
R10 R14 = R-US_R0201: RESISTOR, American symbol; GateName_1: G$1; SymbolName_1: R-US; DeviceSetName: R-US_; MANF: Yageo; MANF#: RC0201FR-072K32L; SPEC: thick film +-1%, 1/20W, 0201; DeviceName: R0201; LibraryName: rcl
R11 R15 = R-US_R0201: RESISTOR, American symbol; GateName_1: G$1; SymbolName_1: R-US; DeviceSetName: R-US_; MANF: Yageo; MANF#: RC0201FR-071KL; SPEC: thick film +-1%, 1/20W, 0201; DeviceName: R0201; LibraryName: rcl
R12 R16 = R-US_R0201: RESISTOR, American symbol; GateName_1: G$1; SymbolName_1: R-US; DeviceSetName: R-US_; MANF: Yageo; MANF#: RC0201FR-07140RL; SPEC: thick film +-1%, 1/20W, 0201; DeviceName: R0201; LibraryName: rcl
R13 R17 = R-US_R0201: RESISTOR, American symbol; GateName_1: G$1; SymbolName_1: R-US; DeviceSetName: R-US_; MANF: Yageo; MANF#: RC0201FR-07845RL; SPEC: thick film +-1%, 1/20W, 0201; DeviceName: R0201; LibraryName: rcl
R80 R82 = R-US_SMALLR0402: RESISTOR, American symbol, small 2-zigzag variant (sheet 2 only); GateName_1: G$1; MANF: Yageo; MANF#: RC0402FR-0733RL; NOTE: RGB LED balance. The green and blue dice are 3.3 V-class parts on a 3.3 V rail, so the resistor never dominates their current -- that is structural and no resistor value fixes it. What the values CAN do is stop red swamping the other two. As built, and as Cmod A7 ships the same LED, 182/182/100 gave red 6.9 mA against green 1.9 and blue 1.5: red about four times either. At 330/33/33 it is red 3.8, green 2.9, blue 2.9. Worst case improves too, not just nominal -- green with a part 0.15 V high in Vf goes from 1.4 mA to 1.8. Lower resistors do make the current MORE sensitive in percentage terms, 77 percent of nominal retained at 100R against 61 at 33R, but the absolute floor is what you see and it rises. Currents read off the datasheet's own Vf/If curve at the working point, not off the 20 mA table.; SPEC: thick film +-1%, 1/16W, 0402; SymbolName_1: R-US_SMALL; DeviceName: R0402; LibraryName: rcl; DeviceSetName: R-US_SMALL
R81 = R-US_SMALLR0402: RESISTOR, American symbol, small 2-zigzag variant (sheet 2 only); GateName_1: G$1; MANF: Yageo; MANF#: RC0402FR-07330RL; NOTE: RGB LED balance. The green and blue dice are 3.3 V-class parts on a 3.3 V rail, so the resistor never dominates their current -- that is structural and no resistor value fixes it. What the values CAN do is stop red swamping the other two. As built, and as Cmod A7 ships the same LED, 182/182/100 gave red 6.9 mA against green 1.9 and blue 1.5: red about four times either. At 330/33/33 it is red 3.8, green 2.9, blue 2.9. Worst case improves too, not just nominal -- green with a part 0.15 V high in Vf goes from 1.4 mA to 1.8. Lower resistors do make the current MORE sensitive in percentage terms, 77 percent of nominal retained at 100R against 61 at 33R, but the absolute floor is what you see and it rises. Currents read off the datasheet's own Vf/If curve at the working point, not off the 20 mA table.; SPEC: thick film +-1%, 1/16W, 0402; SymbolName_1: R-US_SMALL; DeviceName: R0402; LibraryName: rcl; DeviceSetName: R-US_SMALL
R83 R84 = R-US_SMALLR0402: RESISTOR, American symbol, small 2-zigzag variant (sheet 2 only); GateName_1: G$1; MANF: Yageo; MANF#: RC0402FR-07330RL; SPEC: thick film +-1%, 1/16W, 0402; SymbolName_1: R-US_SMALL; DeviceName: R0402; LibraryName: rcl; DeviceSetName: R-US_SMALL
R85 R86 = R-US_SMALLR0402: RESISTOR, American symbol, small 2-zigzag variant (sheet 2 only); GateName_1: G$1; MANF: Yageo; MANF#: RC0402FR-0710KL; SPEC: thick film +-1%, 1/16W, 0402; SymbolName_1: R-US_SMALL; DeviceName: R0402; LibraryName: rcl; DeviceSetName: R-US_SMALL
U$2 = CC_CC: GateName_1: G$1; SymbolName_1: CC_CC; LibraryName: ctambe; DeviceSetName: CC_CC; CC: CC
U$3 = CC_BY: GateName_1: G$1; SymbolName_1: CC_BY; LibraryName: ctambe; DeviceSetName: CC_BY; BY: BY
U$4 = CC_SA: GateName_1: G$1; SymbolName_1: CC_SA; LibraryName: ctambe; DeviceSetName: CC_SA; SA: SA
U$5 = CC_COPYRIGHT: GateName_1: G$1; SymbolName_1: CC_COPYRIGHT; LibraryName: ctambe; DeviceSetName: CC_COPYRIGHT; C: C
X2 = ZULU-CONN: Zulu A7 Board Connector; SymbolName_1: PIN_GATE_IO; GateName_2: CHAN0; SymbolName_2: PIN_GATE_IN; GateName_3: CHAN1; GateName_4: CHAN2; GateName_5: CHAN3; GateName_6: CHAN4; GateName_7: CHAN5; GateName_8: CHAN6; GateName_9: CHAN7; GateName_10: CHAN8; GateName_11: CHAN9; GateName_12: CHAN10; GateName_13: CHAN11; GateName_14: +1.8V; GateName_15: +3.3V; GateName_16: GND; GateName_17: +1.0V; GateName_18: RST#; GateName_19: CHAN14; GateName_20: CHAN15; GateName_21: CHAN16; GateName_22: CHAN17; GateName_23: CHAN18; GateName_24: CHAN19; GateName_25: CHAN20; GateName_26: CHAN21; GateName_27: CHAN22; GateName_28: CHAN23; GateName_29: CHAN24; GateName_30: CHAN25; GateName_31: CHAN26; GateName_32: CHAN27; GateName_33: ANALOG-IO0; GateName_34: ANALOG-IO1; GateName_35: CHAN28; GateName_36: G$1; SymbolName_36: PV_GATE; GateName_37: GND2; GateName_38: CHAN12; GateName_39: CHAN13; GateName_40: GND4; GateName_41: VU; MANF: Sullins; MANF#: 4x PRPC010SAAN-RC; SPEC: four 0.1 in male breakaway header strips, 0.64 mm square gold-flash pins, 2.54 mm pitch, through-hole, mounted from the underside, one part number, four per board: PRPC010SAAN-RC 1x10 for pins 1-10, 11-20, 21-30 and 31-40 (Rev 2, 2026-11-11: both landings moved one pin west so each row splits 10 + 10); NOTE: Pin field ZULU-DIP37 (Rev 2, 2026-11-11): 40 pins of 1.016 mm on 2.54 mm pitch, two rows 22.86 mm (0.900 in) apart, numbered 1-40 straight through and skipping both landings. The rows are mirror images: top row pins 1-10 (x 59.69..36.83) = GND, CHAN-CLK, CHAN0..CHAN7, FOUR positions for the micro-USB X1 (34.29..26.67, X1 centred on x 30.48), pins 11-20 (24.13..1.27) = CHAN8..CHAN13, GND, +3.3V, +1.8V, +1.0V; bottom row pins 21-30 (59.69..36.83) = GND, VU, RST#, CHAN14..CHAN20, FOUR positions for the LiPo header X4 at the SAME four x values (X4 centred on x 30.48, top side, opposite X1), pins 31-40 (24.13..1.27) = CHAN21..CHAN28, ANALOG-IO0, ANALOG-IO1. Each landing is 12.70 mm between the neighbouring pin centres (36.83 and 24.13). Rev 2 change: pins 10 (CHAN7) and 30 (CHAN20) moved from x 26.67 to 36.83 and X1/X4 moved 2.54 mm west, so the strips are four identical 1x10. Pin numbers and nets are unchanged. Three grounds (1, 17, 21); 3.3 V for the header is pin 18 alone; pin 22 VU sources the 4.4 V rail. Sullins PRPC strips fit the holes (0.64 mm square pins, Sullins recommends 1.02 mm). Alternate: any 2.54 mm 1x40 breakaway strip cut to 10 + 10 twice.; GateName_1: CHAN-CLK; SymbolName_3: PIN_GATE_IO; SymbolName_4: PIN_GATE_IO; SymbolName_5: PIN_GATE_IO; SymbolName_6: PIN_GATE_IO; SymbolName_7: PIN_GATE_IO; SymbolName_8: PIN_GATE_IO; SymbolName_9: PIN_GATE_IN; SymbolName_10: PIN_GATE_IO; SymbolName_11: PIN_GATE_IO; SymbolName_12: PIN_GATE_IN; SymbolName_13: PIN_GATE_IO; SymbolName_14: PIN_GATE_IO; SymbolName_15: PIN_GATE_IO; SymbolName_16: PIN_GATE_IO; SymbolName_17: PIN_GATE_IO; SymbolName_18: PIN_GATE_IO; SymbolName_19: PIN_GATE_IO; SymbolName_20: PIN_GATE_IO; SymbolName_21: PIN_GATE_IN; SymbolName_22: PIN_GATE_IO; SymbolName_23: PIN_GATE_IO; SymbolName_24: PIN_GATE_IO; SymbolName_25: PIN_GATE_IO; SymbolName_26: PIN_GATE_IN; SymbolName_27: PIN_GATE_IO; SymbolName_28: PIN_GATE_IO; SymbolName_29: PIN_GATE_IN; SymbolName_30: PIN_GATE_IO; SymbolName_31: PIN_GATE_IO; SymbolName_32: PIN_GATE_IO; SymbolName_33: PIN_GATE_IO; SymbolName_34: PIN_GATE_IO; SymbolName_35: PIN_GATE_IO; SymbolName_37: PIN_GATE_IO; SymbolName_38: PIN_GATE_IO; SymbolName_39: PIN_GATE_IO; SymbolName_40: PIN_GATE_IO; SymbolName_41: PIN_GATE_IO; LibraryName: ctambe; DeviceSetName: ZULU-CONN